# Altium project davidgeiger-rotaryswitch-v1.0.PrjPcb
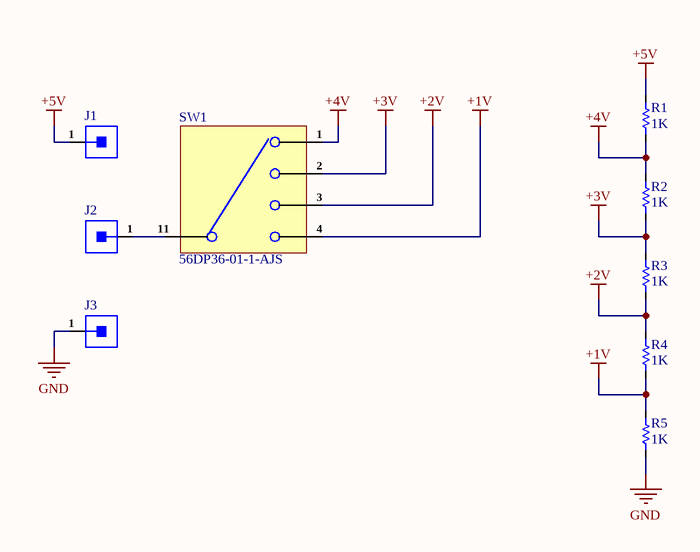
[diagram p0: Schematic.SchDoc]
1 sheet, 9 parts. Net scope: global (net labels, ports and power ports of the same name join across sheets).
Board file: PCB_Rotaryswitch-v1.0.PcbDoc

## Sheet Schematic.SchDoc
size A4; SheetNumber: 1; SheetTotal: 1

### Parts
J1  X6511WV-01H-C60D30  [HDR 1x1 TH Male]  (value not drawn)
J2  X6511WV-01H-C60D30  [HDR 1x1 TH Male]  (value not drawn)
J3  X6511WV-01H-C60D30  [HDR 1x1 TH Male]  (value not drawn)
R1  1K  [Res-0603]
R2  1K  [Res-0603]
R3  1K  [Res-0603]
R4  1K  [Res-0603]
R5  1K  [Res-0603]
SW1  56DP36-01-1-AJS  [56DP36-01-1-AJS]

### Nets
+1V: R4.1 R5.2 SW1.4
+2V: R3.1 R4.2 SW1.3
+3V: R2.1 R3.2 SW1.2
+4V: R1.1 R2.2 SW1.1
+5V: J1.1 R1.2
GND: J3.1 R5.1
NetJ2_1: J2.1 SW1.11(COMMON)

### Notes on the sheet
- File:
- Title:
- Date:
- Page
- Num:
- Total:
- Drawn By: Huzaifa Ali

### Library data of the parts
J1-J3 = X6511WV-01H-C60D30: Gold 250V 3A Square Pins 2.5mm 1P 260℃ 6mm -40℃~+105℃ 3mm 2.54mm Brass Black Plugin 2.54mm 1x1P Plugin,P=2.54mm Pin Headers ROHS; Manufacturer: XKB; Item Type: Male Header; Manufacturer Part Number: X6511WV-01H-C60D30; Package: Plugin,P=2.54mm; LCSC Part Number: C5242194; ComponentLink1Description: LCSC; ComponentLink1URL: https://www.lcsc.com/product-detail/Pin-Headers_XKB-Connection-X6511WV-01H-C60D30_C5242194.html
R1-R5 = RT0603BRD071KL: RES SMD 1K OHM 0.1% 1/10W 0603; Manufacturer: Yageo; Resistance: 1kR; Power Rating: 100mW; Voltage Rating: 75V; Temperature Coefficient: 25ppm/°C; Voltage Rating (DC): 50V; Item Type: Resistor; Supplier 1: Arrow Electronics; Manufacturer Part Number: RT0603BRD071KL; RoHS: Yes; Category: Chip SMD Resistors; Stock 1: 130000; Pricing 1: 5000=0.03900, 10000=0.03450, 25000=0.03070, 50000=0.02040 (USD); Mount: Surface Mount; Case/Package: 0603; Case Code (Metric): 1608; Case Code (Imperial): 0603; Contact Plating: Tin,Lead; Size Code: 0603; Min Operating Temperature: -55°C; Max Operating Temperature: 125°C; Package Quantity: 5000; Packaging: Tape and Reel; Resistor Type: Thin Film; Number of Terminations: 2; Termination: SMD/SMT; Max Power Dissipation: 100mW; Features: Moisture Resistant; Series: RT; Technology: THIN FILM; Construction: Rectangular; Length: 1.6mm; Width: 0.031inch; Height: 0.022inch; Depth: 0.8mm; Military Standard: Not; Lead Free: Lead Free; RoHS Compliant: Yes; ComponentLink1URL: https://datasheet.ciiva.com/11819/0900766b8079c86e-11819652.pdf?src-supplier=RSComponents; ComponentLink1Description: https://datasheet.ciiva.com/11819/0900766b8079c86e-11819652.pdf?src-supplier=RSComponents; ComponentLink2URL: https://datasheet.ciiva.com/5624/pyu-rt-1-to-0-05-rohs-l-4-5624759.pdf?src-supplier=Mouser; ComponentLink2Description: https://datasheet.ciiva.com/5624/pyu-rt-1-to-0-05-rohs-l-4-5624759.pdf?src-supplier=Mouser; ComponentLink3URL: https://datasheet.ciiva.com/29718/pyu-rt-1-to-0-05-rohs-l-4-29718010.pdf?src-supplier=Digi-Key; ComponentLink3Description: https://datasheet.ciiva.com/29718/pyu-rt-1-to-0-05-rohs-l-4-29718010.pdf?src-supplier=Digi-Key; ComponentLink4URL: https://datasheet.ciiva.com/29718/pyu-rt-1-to-0-05-rohs-l-4-29718011.pdf?src-supplier=Digi-Key; ComponentLink4Description: https://datasheet.ciiva.com/29718/pyu-rt-1-to-0-05-rohs-l-4-29718011.pdf?src-supplier=Digi-Key; Supplier Part Number 1: RT0603BRD071KL; LCSC Part Number: C110776
SW1 = 56DP36-01-1-AJS: 2 - 10 positions 36deg Rotary Switch; 115 V ac; 30 V dc; 200 mA; Shaft; Manufacturer: Grayhill; Item Type: Rotary Switches; Supplier: Digikey; Supplier Part Number: 56DP36-01-1-AJS-ND; Manufacturer Part Number: 56DP36-01-1-AJS; RoHS: Yes; Pricing: 1=24.84, 5=21.334, 10=19.997, 25=18.3256, 50=17.156, 100=16.0977, 250=14.76088, 500=14.4824 (USD); ComponentLink1URL: https://datasheet.ciiva.com/2887/rotary-56-2887598.pdf?src-supplier=Digikey; ComponentLink1Description: https://datasheet.ciiva.com/2887/rotary-56-2887598.pdf?src-supplier=Digikey